# Altium project AudioMoth-v1.2.0.PrjPcb (part 3 of 3)
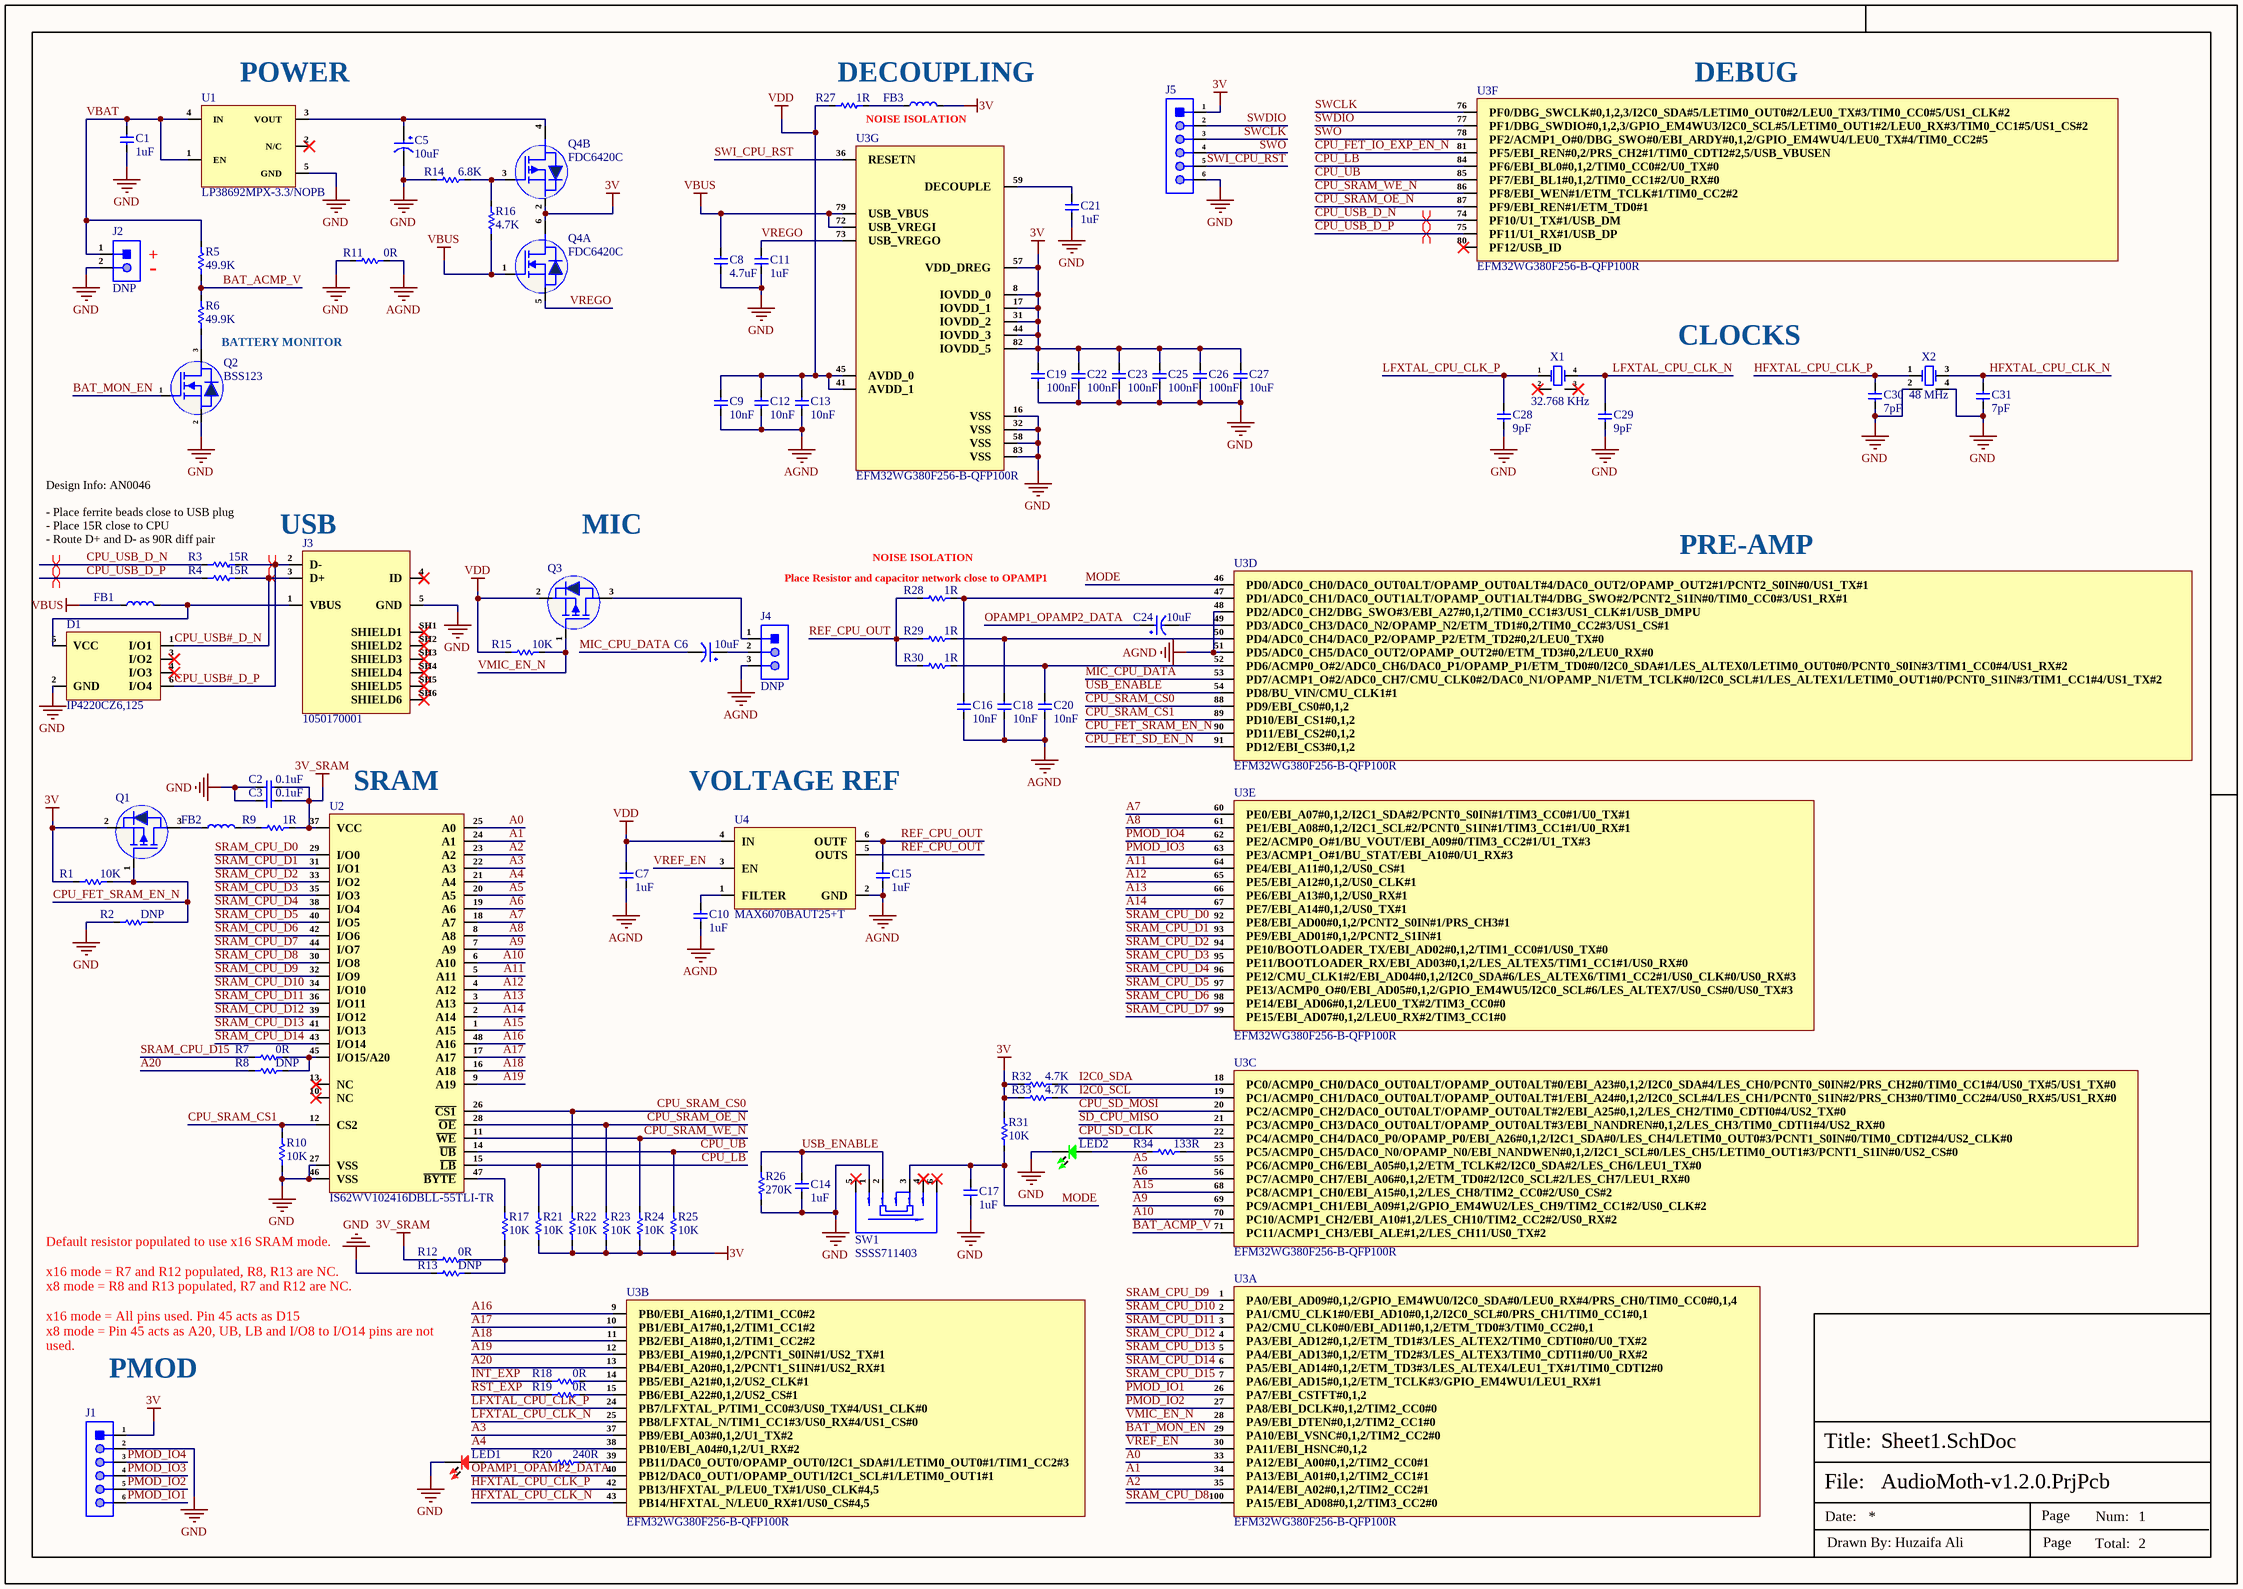
[diagram p3: Sheet1.SchDoc]

## Sheet Sheet1.SchDoc (continued)

### Library data of the parts (continued)
U2 = IS62WV102416DBLL-55TLI-TR: IC SRAM 16MBIT PARALLEL 48TSOP I; Manufacturer: ISSI; Memory Format: Volatile,SRAM; Memory Size: 16Mb; Access Time: 55ns; Supplier: Digikey; Supplier Part Number: 706-IS62WV102416DBLL-55TLI-TRCT-ND; Manufacturer Part Number: IS62WV102416DBLL-55TLI-TR; RoHS: Yes; Item Type: IC; Stock: 1390; Pricing: 1=11.11, 10=9.865, 25=9.408, 50=9.0762, 100=8.7557, 250=8.34852, 500=8.05256 (USD); Mounting Technology: Surface Mount; Case/Package: TFSOP; Min Operating Temperature: -40°C; Max Operating Temperature: 85°C; Packaging: Tape and Reel; Series: -; RoHS Compliant: Yes; ComponentLink1URL: http://www.mouser.com/ds/2/198/62-65WV102416DALL-DBLL-319010.pdf?src-supplier=Mouser; ComponentLink1Description: http://www.mouser.com/ds/2/198/62-65WV102416DALL-DBLL-319010.pdf?src-supplier=Mouser; ComponentLink2URL: http://www.issi.com/WW/pdf/62-65WV102416DALL-DBLL.pdf?src-supplier=Avnet; ComponentLink2Description: http://www.issi.com/WW/pdf/62-65WV102416DALL-DBLL.pdf?src-supplier=Avnet; ComponentLink3URL: http://www.issi.com/WW/pdf/62-65WV102416DALL-DBLL.pdf?src-supplier=Digikey; ComponentLink3Description: http://www.issi.com/WW/pdf/62-65WV102416DALL-DBLL.pdf?src-supplier=Digikey
U3 = EFM32WG380F256-B-QFP100R: IC MCU 32BIT 256KB FLASH 100LQFP; Manufacturer: Silicon Labs; Supplier: Mouser; Supplier Part Number: 634-WG380256BQFP100R; Manufacturer Part Number: EFM32WG380F256-B-QFP100R; Item Type: IC; Stock: 2000; Pricing: 1=13.12, 10=12.06, 50=11.56, 100=10.18, 1000=8.31, 10000=8.31 (USD)
U4 = MAX6070BAUT25+T: IC VREF SERIES 0.08% SOT23-6; Manufacturer: Analog Devices; Output Type: 6317OutputType; Reference Type: 6142ReferenceType; Max Supply Voltage: 5.5V; Max Output current: 10mA; Min Input Voltage: 2.7V; Min Output Voltage: 2.5V; Number of Channels: 1NUMBER; Operating Supply Current: 300uA; Quiescent Current: 235uA; Supplier: Mouser; LCSC Part Number: C143531; Manufacturer Part Number: MAX6070BAUT25+T; RoHS: No; Item Type: IC; Stock: 5392; Pricing: 1=3.56, 10=2.63, 50=2.63, 100=2.19, 1000=1.72, 10000=1.53 (USD); Mounting Technology: 8Mount; Case/Package: 942Case; Pins: 6NUMBER; Min Operating Temperature: -40°C; Max Operating Temperature: 125°C; Tolerance: 0.08%; Output Current: 10mA; Output Voltage: 2.5V; Radiation Hardening: 5898YesNo; ComponentLink1URL: https://datasheet.octopart.com/MAX6070BAUT25%2BT-Analog-Devices-datasheet-134530559.pdf?src-supplier=LKR; ComponentLink1Description: https://datasheet.octopart.com/MAX6070BAUT25%2BT-Analog-Devices-datasheet-134530559.pdf?src-supplier=LKR
X1 = Q13MC14620001: 32.768kHz 7pF ±20ppm MC-146 Crystals ROHS; Manufacturer: Seiko Epson; Manufacturer Part Number: Q13MC14620001; Package: MC-146; LCSC Part Number: C3013800; Item Type: Crystals; ComponentLink1Description: LCSC; ComponentLink1URL: https://www.lcsc.com/product-detail/Crystals_Seiko-span-style-background-color-ff0-Epson-span-Q13MC14620001_C3013800.html
X2 = XRCGB48M000F4M00R0: CRYSTAL 48.0000MHZ 6PF SMD; Manufacturer: Murata; Item Type: Crystals; Supplier: Mouser; LCSC Part Number: C1986590; Manufacturer Part Number: XRCGB48M000F4M00R0; RoHS: Yes; Stock: 4711; Pricing: 1=0.3, 10=0.231, 50=0.231, 100=0.211, 1000=0.179, 10000=0.128 (USD); ComponentLink1URL: https://datasheet.ciiva.com/3852/part29-3852564.pdf?src-supplier=Arrow+Electronics; ComponentLink1Description: https://datasheet.ciiva.com/3852/part29-3852564.pdf?src-supplier=Arrow+Electronics; ComponentLink2URL: https://datasheet.ciiva.com/852/p79e-852304.pdf?src-supplier=Digikey; ComponentLink2Description: https://datasheet.ciiva.com/852/p79e-852304.pdf?src-supplier=Digikey; ComponentLink3URL: https://datasheet.ciiva.com/852/p79e-852305.pdf?src-supplier=Digikey; ComponentLink3Description: https://datasheet.ciiva.com/852/p79e-852305.pdf?src-supplier=Digikey; ComponentLink4URL: https://datasheet.ciiva.com/852/p79e-852306.pdf?src-supplier=Digikey; ComponentLink4Description: https://datasheet.ciiva.com/852/p79e-852306.pdf?src-supplier=Digikey; ComponentLink5URL: https://datasheet.ciiva.com/1369/l0445e-1369913.pdf?src-supplier=Farnell; ComponentLink5Description: https://datasheet.ciiva.com/1369/l0445e-1369913.pdf?src-supplier=Farnell; ComponentLink6URL: https://datasheet.ciiva.com/1361/p79e-1361575.pdf?src-supplier=Element14; ComponentLink6Description: https://datasheet.ciiva.com/1361/p79e-1361575.pdf?src-supplier=Element14

## Sheet Sheet2.SchDoc
size 420 x 297 mm; SheetNumber: 2; SheetTotal: 2
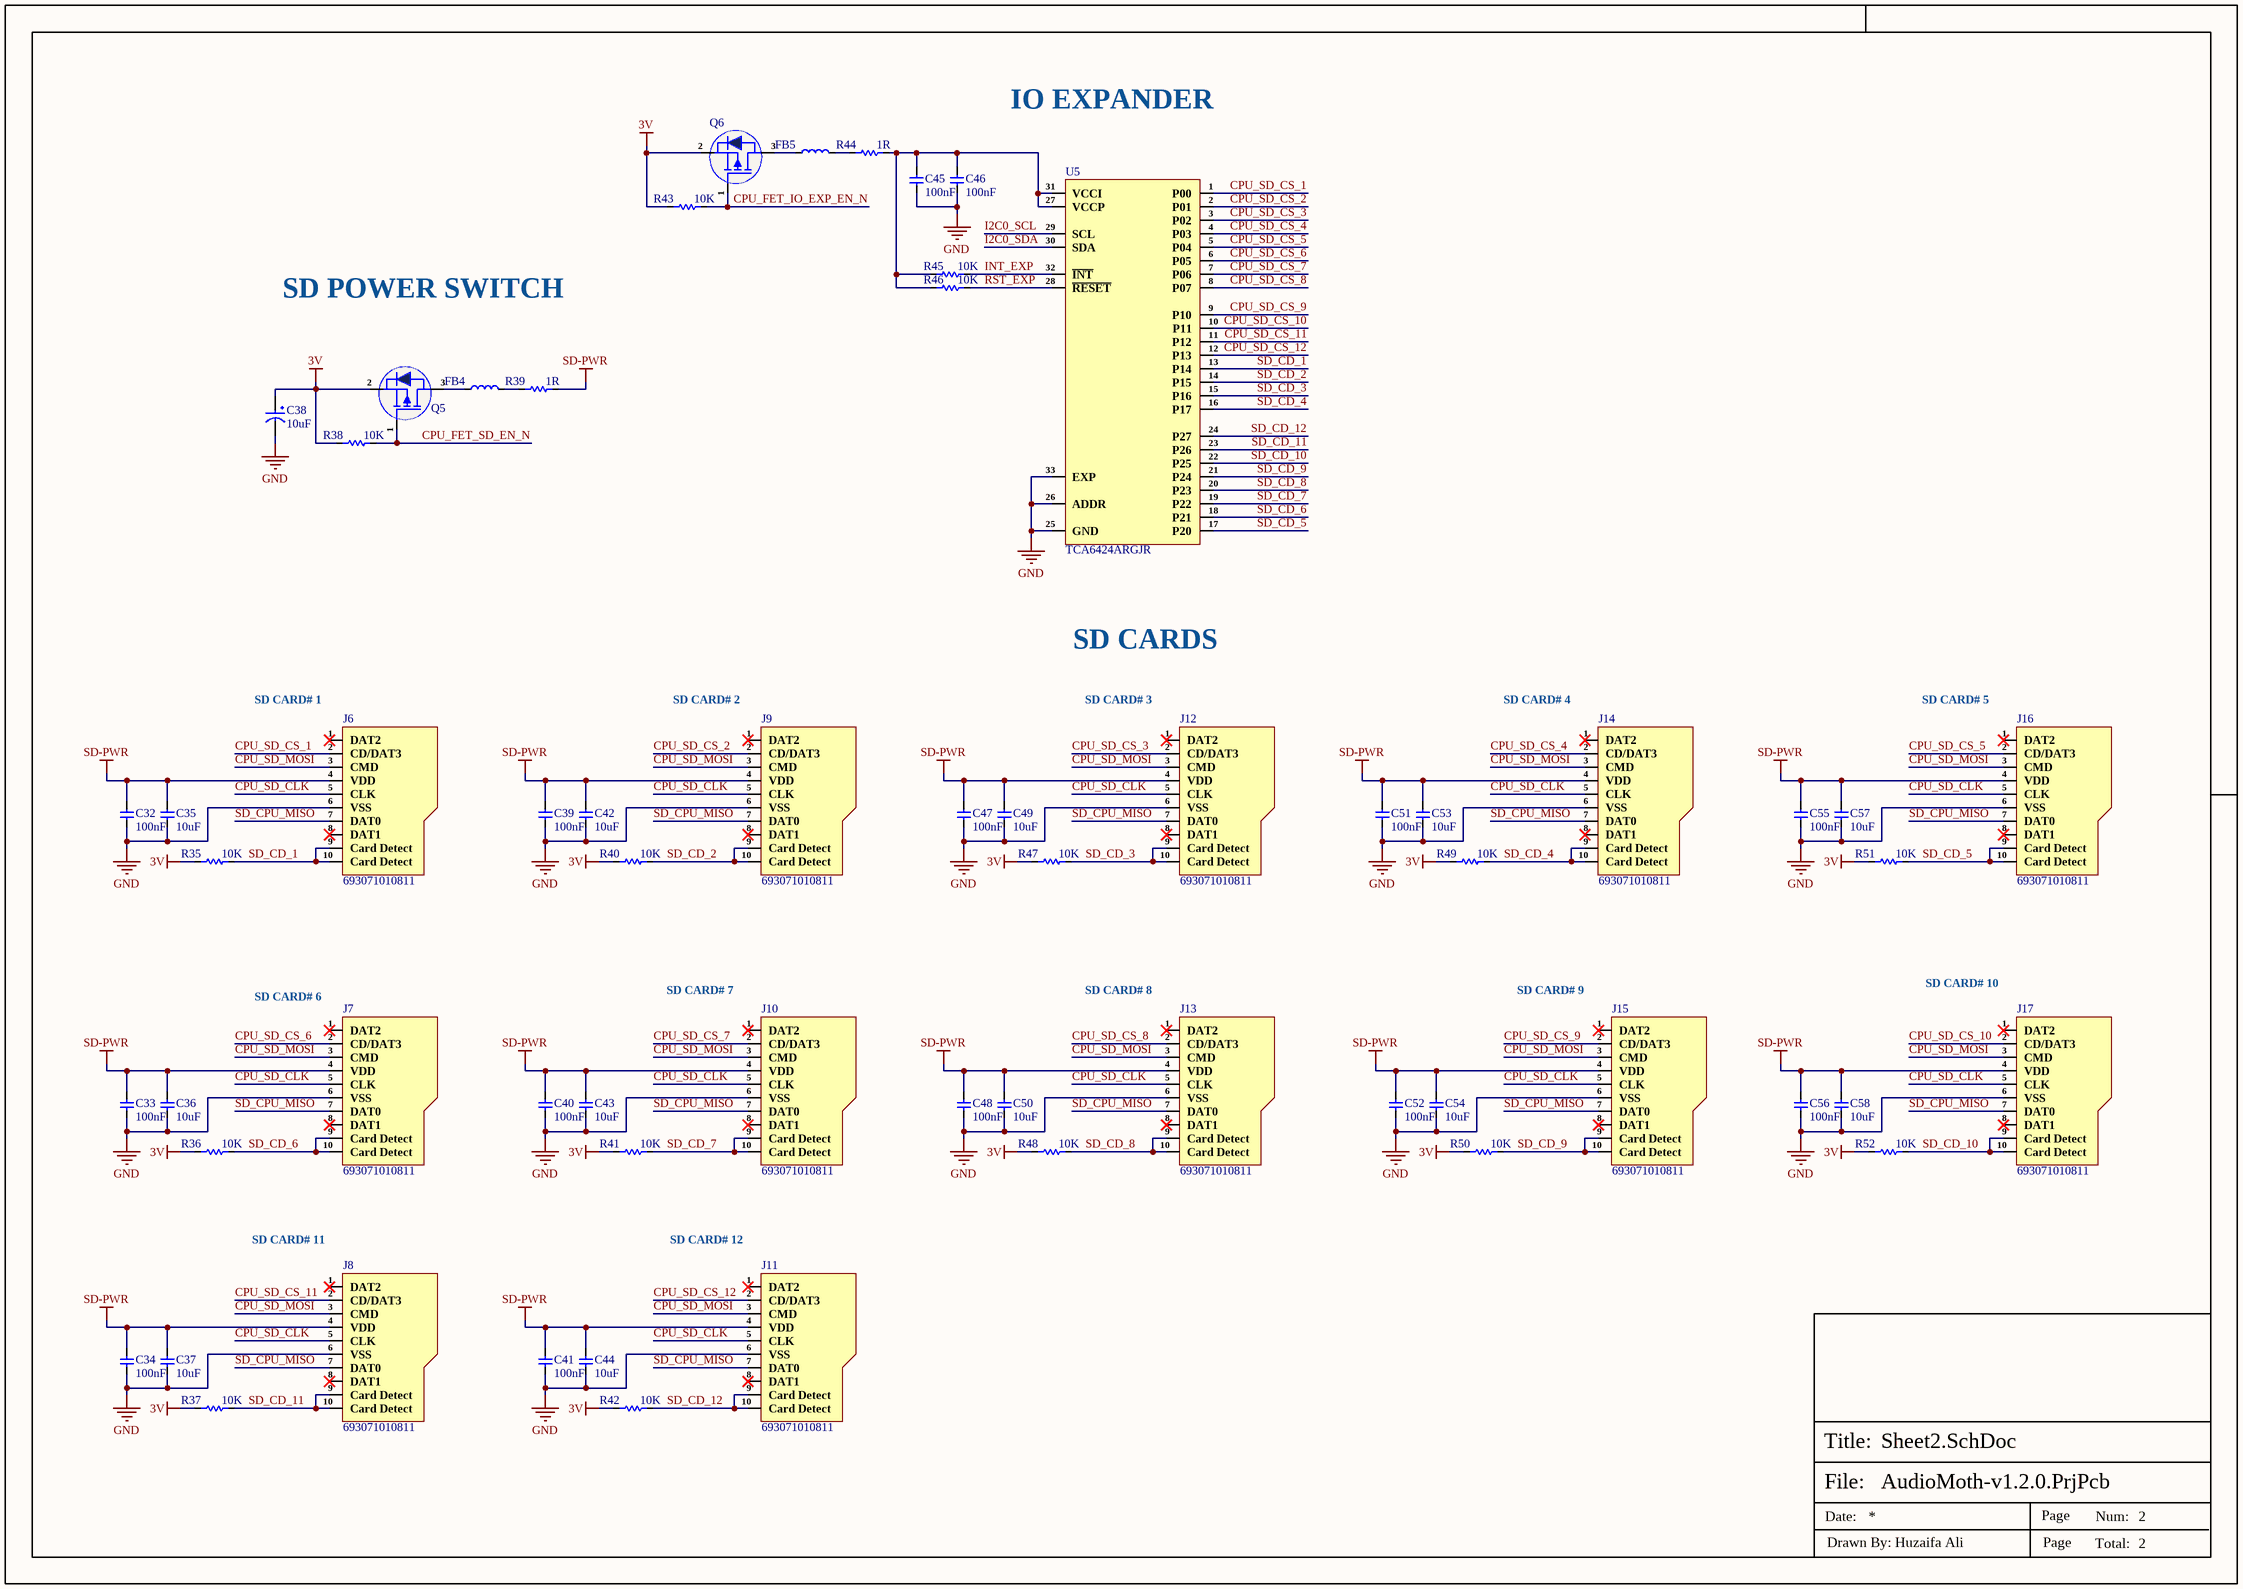
[diagram p1: Sheet2.SchDoc]

### Parts
C32  100nF  [cap-0402]
C33  100nF  [cap-0402]
C34  100nF  [cap-0402]
C35  10uF  [Cap-0603]
C36  10uF  [Cap-0603]
C37  10uF  [Cap-0603]
C38  10uF  [Case-A]
C39  100nF  [cap-0402]
C40  100nF  [cap-0402]
C41  100nF  [cap-0402]
C42  10uF  [Cap-0603]
C43  10uF  [Cap-0603]
C44  10uF  [Cap-0603]
C45  100nF  [cap-0402]
C46  100nF  [cap-0402]
C47  100nF  [cap-0402]
C48  100nF  [cap-0402]
C49  10uF  [Cap-0603]
C50  10uF  [Cap-0603]
C51  100nF  [cap-0402]
C52  100nF  [cap-0402]
C53  10uF  [Cap-0603]
C54  10uF  [Cap-0603]
C55  100nF  [cap-0402]
C56  100nF  [cap-0402]
C57  10uF  [Cap-0603]
C58  10uF  [Cap-0603]
FB4  BLM18HG601SN1D  [IND-0603 (1608 Metric)]  (value not drawn)
FB5  BLM18HG601SN1D  [IND-0603 (1608 Metric)]  (value not drawn)
J6  693071010811  [693071010811]
J7  693071010811  [693071010811]
J8  693071010811  [693071010811]
J9  693071010811  [693071010811]
J10  693071010811  [693071010811]
J11  693071010811  [693071010811]
J12  693071010811  [693071010811]
J13  693071010811  [693071010811]
J14  693071010811  [693071010811]
J15  693071010811  [693071010811]
J16  693071010811  [693071010811]
J17  693071010811  [693071010811]
Q5  DMG3415U  [SOT-23]  (value not drawn)
Q6  LBSS84WT1G  [SC-70]  (value not drawn)
R35  10K  [Res-0402]
R36  10K  [Res-0402]
R37  10K  [Res-0402]
R38  10K  [Res-0402]
R39  1R  [Res-0402]
R40  10K  [Res-0402]
R41  10K  [Res-0402]
R42  10K  [Res-0402]
R43  10K  [Res-0402]
R44  1R  [Res-0402]
R45  10K  [Res-0402]
R46  10K  [Res-0402]
R47  10K  [Res-0402]
R48  10K  [Res-0402]
R49  10K  [Res-0402]
R50  10K  [Res-0402]
R51  10K  [Res-0402]
R52  10K  [Res-0402]
U5  TCA6424ARGJR  [32-UQFN (5x5)]

### Nets
3V: C38.1 Q5.2(S) Q6.2(S) R35.1 R36.1 R37.1 R38.1 R40.1 R41.1 R42.1 R43.1 R47.1 R48.1 R49.1 R50.1 R51.1 R52.1
GND: C32.1 C33.1 C34.1 C35.1 C36.1 C37.1 C38.2 C39.1 C40.1 C41.1 C42.1 C43.1 C44.1 C45.1 C46.1 C47.1 C48.1 C49.1 C50.1 C51.1 C52.1 C53.1 C54.1 C55.1 C56.1 C57.1 C58.1 J6.6(VSS) J7.6(VSS) J8.6(VSS) J9.6(VSS) J10.6(VSS) J11.6(VSS) J12.6(VSS) J13.6(VSS) J14.6(VSS) J15.6(VSS) J16.6(VSS) J17.6(VSS) U5.25(GND) U5.26(ADDR) U5.33(EXP)
SD-PWR: C32.2 C33.2 C34.2 C35.2 C36.2 C37.2 C39.2 C40.2 C41.2 C42.2 C43.2 C44.2 C47.2 C48.2 C49.2 C50.2 C51.2 C52.2 C53.2 C54.2 C55.2 C56.2 C57.2 C58.2 J6.4(VDD) J7.4(VDD) J8.4(VDD) J9.4(VDD) J10.4(VDD) J11.4(VDD) J12.4(VDD) J13.4(VDD) J14.4(VDD) J15.4(VDD) J16.4(VDD) J17.4(VDD) R39.1
CPU_FET_IO_EXP_EN_N: Q6.1(G) R43.2
CPU_FET_SD_EN_N: Q5.1(G) R38.2
CPU_SD_CLK: J6.5(CLK) J7.5(CLK) J8.5(CLK) J9.5(CLK) J10.5(CLK) J11.5(CLK) J12.5(CLK) J13.5(CLK) J14.5(CLK) J15.5(CLK) J16.5(CLK) J17.5(CLK)
CPU_SD_CS_1: J6.2(CD/DAT3) U5.1(P00)
CPU_SD_CS_2: J9.2(CD/DAT3) U5.2(P01)
CPU_SD_CS_3: J12.2(CD/DAT3) U5.3(P02)
CPU_SD_CS_4: J14.2(CD/DAT3) U5.4(P03)
CPU_SD_CS_5: J16.2(CD/DAT3) U5.5(P04)
CPU_SD_CS_6: J7.2(CD/DAT3) U5.6(P05)
CPU_SD_CS_7: J10.2(CD/DAT3) U5.7(P06)
CPU_SD_CS_8: J13.2(CD/DAT3) U5.8(P07)
CPU_SD_CS_9: J15.2(CD/DAT3) U5.9(P10)
CPU_SD_CS_10: J17.2(CD/DAT3) U5.10(P11)
CPU_SD_CS_11: J8.2(CD/DAT3) U5.11(P12)
CPU_SD_CS_12: J11.2(CD/DAT3) U5.12(P13)
CPU_SD_MOSI: J6.3(CMD) J7.3(CMD) J8.3(CMD) J9.3(CMD) J10.3(CMD) J11.3(CMD) J12.3(CMD) J13.3(CMD) J14.3(CMD) J15.3(CMD) J16.3(CMD) J17.3(CMD)
I2C0_SCL: U5.29(SCL)
I2C0_SDA: U5.30(SDA)
INT_EXP: R45.1 U5.32(~{INT})
RST_EXP: R46.1 U5.28(~{RESET})
SD_CD_1: J6.9(Card_Detect) J6.10(Card_Detect) R35.2 U5.13(P14)
SD_CD_2: J9.9(Card_Detect) J9.10(Card_Detect) R40.2 U5.14(P15)
SD_CD_3: J12.9(Card_Detect) J12.10(Card_Detect) R47.2 U5.15(P16)
SD_CD_4: J14.9(Card_Detect) J14.10(Card_Detect) R49.2 U5.16(P17)
SD_CD_5: J16.9(Card_Detect) J16.10(Card_Detect) R51.2 U5.17(P20)
SD_CD_6: J7.9(Card_Detect) J7.10(Card_Detect) R36.2 U5.18(P21)
SD_CD_7: J10.9(Card_Detect) J10.10(Card_Detect) R41.2 U5.19(P22)
SD_CD_8: J13.9(Card_Detect) J13.10(Card_Detect) R48.2 U5.20(P23)
SD_CD_9: J15.9(Card_Detect) J15.10(Card_Detect) R50.2 U5.21(P24)
SD_CD_10: J17.9(Card_Detect) J17.10(Card_Detect) R52.2 U5.22(P25)
SD_CD_11: J8.9(Card_Detect) J8.10(Card_Detect) R37.2 U5.23(P26)
SD_CD_12: J11.9(Card_Detect) J11.10(Card_Detect) R42.2 U5.24(P27)
SD_CPU_MISO: J6.7(DAT0) J7.7(DAT0) J8.7(DAT0) J9.7(DAT0) J10.7(DAT0) J11.7(DAT0) J12.7(DAT0) J13.7(DAT0) J14.7(DAT0) J15.7(DAT0) J16.7(DAT0) J17.7(DAT0)
NetC45_2: C45.2 C46.2 R44.1 R45.2 R46.2 U5.27(VCCP) U5.31(VCCI)
NetFB4_1: FB4.1 Q5.3(D)
NetFB4_2: FB4.2 R39.2
NetFB5_1: FB5.1 Q6.3(D)
NetFB5_2: FB5.2 R44.2

Not connected (* = marked no-connect by the designer): J6 1(DAT2)* 8(DAT1)*; J7 1(DAT2)* 8(DAT1)*; J8 1(DAT2)* 8(DAT1)*; J9 1(DAT2)* 8(DAT1)*; J10 1(DAT2)* 8(DAT1)*; J11 1(DAT2)* 8(DAT1)*; J12 1(DAT2)* 8(DAT1)*; J13 1(DAT2)* 8(DAT1)*; J14 1(DAT2)* 8(DAT1)*; J15 1(DAT2)* 8(DAT1)*; J16 1(DAT2)* 8(DAT1)*; J17 1(DAT2)* 8(DAT1)*

### Notes on the sheet
- IO EXPANDER
- SD POWER SWITCH
- SD CARDS
- (near J6) SD CARD# 1
- (near J9) SD CARD# 2
- (near J12) SD CARD# 3
- (near J14) SD CARD# 4
- (near J16) SD CARD# 5
- (near J7) SD CARD# 6
- (near J10) SD CARD# 7
- (near J13) SD CARD# 8
- (near J15) SD CARD# 9
- (near J17) SD CARD# 10
- (near J8) SD CARD# 11
- (near J11) SD CARD# 12
- File:
- Title:
- Date:
- Page
- Num:
- Total:
- Drawn By: Huzaifa Ali

### Library data of the parts
C32-C34 C39-C41 C45-C48 C51 C52 C55 C56 = C1005X7R1H104KT000F: CAP CER 0.1UF 50V X7R 0402; Manufacturer: TDK; Tolerance: 10%; Voltage: 25V; Item Type: Capacitor; Supplier 1: Avnet; Manufacturer Part Number: C1005X7R1H104KT000F; RoHS: No; Category: Ceramic Capacitors; Dielectric: X7R; Supplier Part Number 1: C1005X7R1H104KT000F; LCSC Part Number: C361198; ComponentLink1Description: LCSC; ComponentLink1URL: https://www.lcsc.com/product-detail/Multilayer-Ceramic-Capacitors-MLCC-SMD-SMT_TDK-C1005X7R1H104KT000F_C361198.html
C35-C37 C42-C44 C49 C50 C53 C54 C57 C58 = CL10A106MA8NRNC: CAP CER 10UF 25V X5R 0603; Manufacturer: Samsung; Tolerance: 20%; Supplier 1: Avnet; Manufacturer Part Number: CL10A106MA8NRNC; RoHS: Yes; Category: Ceramic Capacitors; Pricing 1: 4000=0.03753, 8000=0.03700, 16000=0.03595, 24000=0.03515, 32000=0.03383, 40000=0.03304, 400000=0.03225 (USD); Mount: Surface Mount; Case/Package: 0603; Case Code (Metric): 1608; Case Code (Imperial): 0603; Contact Plating: Tin; Min Operating Temperature: -55°C; Max Operating Temperature: 85°C; Package Quantity: 1; Packaging: Tape and Reel; Capacitance: 10uF; Voltage Rating: 25V; Dielectric: X5R; Termination: Wraparound; Series: CL; Construction: Flat; Length: 0.063inch; Width: 0.031inch; Thickness: 0.035inch; Lead Free: Lead Free; RoHS Compliant: Yes; ComponentLink1URL: https://datasheet.ciiva.com/25766/cl10a106ma8nrnc-25766562.pdf?src-supplier=Digi-Key; ComponentLink1Description: https://datasheet.ciiva.com/25766/cl10a106ma8nrnc-25766562.pdf?src-supplier=Digi-Key; Supplier Part Number 1: CL10A106MA8NRNC; LCSC Part Number: C96446
C38 = CA45-A-16V-10uF-K: 10uF 16V 2Ω@100kHz ±10% CASE-A-3216-16(mm) Tantalum Capacitors ROHS; Manufacturer: TORCH; Manufacturer Part Number: CA45-A-16V-10μF-K; Package: CASE-A-3216-16(mm); LCSC Part Number: C185774; Item Type: Capacitors; ComponentLink1Description: LCSC; ComponentLink1URL: https://www.lcsc.com/product-detail/Tantalum-Capacitors_TORCH-CA45-A-16V-10-F-K_C185774.html
FB4 FB5 = BLM18HG601SN1D: FERRITE BEAD 600 OHM 0603 1LN; Manufacturer: Murata; Manufacturer Series: BLM18H; Item Type: Ferrite Beads; Material: Steel,Ferrite; Impedance: 600R; Tolerance: 25%; DC Resistance (DCR): 1R; Max DC Current: 200mA; Number of Lines: 1; Test Frequency: 100MHz; Supplier: Future Electronics; LCSC Part Number: C85830; Manufacturer Part Number: BLM18HG601SN1D; RoHS: Yes; Stock: 80000; Pricing: 4000=0.0428, 12000=0.0412, 20000=0.0405, 80000=0.0387, 120000=0.0375 (USD); Case/Package: 0603; Pins: 2; Core Material: Ferrite; Case Code (Metric): 1608; Case Code (Imperial): 0603; Weight: 7.1E-05oz; Terminal Finish: Tin; Min Operating Temperature: -55°C; Max Operating Temperature: 125°C; Package Quantity: 1; Packaging: Tape and Reel; Current Rating: 200mA; ESR (Equivalent Series Resistance): 600R; Max Current Rating: 200mA; Termination: SMD/SMT; DC Current: 200mA; Number of Circuits: 1; Series: BLM18H; Channels: 1; DC Resistance-Max: 1R; Length: 1.6mm; Width: 0.8mm; Height: 0.8mm; Depth: 0.8mm; Radiation Hardening: No; Reach SVHC Compliant: No; Lead Free: Lead Free; RoHS Compliant: Yes; ComponentLink1URL: https://datasheet.ciiva.com/19458/1844993-19458415.pdf?src-supplier=Jameco; ComponentLink1Description: https://datasheet.ciiva.com/19458/1844993-19458415.pdf?src-supplier=Jameco; ComponentLink2URL: https://datasheet.ciiva.com/11800/0900766b811b5866-11800880.pdf?src-supplier=Rs; ComponentLink2Description: https://datasheet.ciiva.com/11800/0900766b811b5866-11800880.pdf?src-supplier=Rs; ComponentLink3URL: https://datasheet.ciiva.com/41449/001171708-da-01-en-chip-drossel0603-600r-200ma-1-6x0-8mm-41449386.pdf?src-supplier=Conrad; ComponentLink3Description: https://datasheet.ciiva.com/41449/001171708-da-01-en-chip-drossel0603-600r-200ma-1-6x0-8mm-41449386.pdf?src-supplier=Conrad; ComponentLink4URL: https://datasheet.ciiva.com/41449/001172283-da-01-en-drossel-0603-600r-1-6x0-8mm-4000st-41449622.pdf?src-supplier=Conrad; ComponentLink4Description: https://datasheet.ciiva.com/41449/001172283-da-01-en-drossel-0603-600r-1-6x0-8mm-4000st-41449622.pdf?src-supplier=Conrad; ComponentLink5URL: https://datasheet.ciiva.com/6212/l0110s0101blm18h-6212335.pdf?src-supplier=Digikey; ComponentLink5Description: https://datasheet.ciiva.com/6212/l0110s0101blm18h-6212335.pdf?src-supplier=Digikey; ComponentLink6URL: https://datasheet.ciiva.com/3081/l0110s0101blm18h-3081629.pdf?src-supplier=Avnet; ComponentLink6Description: https://datasheet.ciiva.com/3081/l0110s0101blm18h-3081629.pdf?src-supplier=Avnet; ComponentLink7URL: https://datasheet.ciiva.com/3082/l0110s0101blm18h-3082720.pdf?src-supplier=Avnet; ComponentLink7Description: https://datasheet.ciiva.com/3082/l0110s0101blm18h-3082720.pdf?src-supplier=Avnet
J6-J17 = 693071010811: CONN MICRO SD CARD PUSH-PUSH R/A; Manufacturer: Wurth Electronics; Item Type: Memory Connectors; Number of Contacts: 8; Current Rating: 500mA; Insulation Resistance: 1GR; Operating Supply Voltage: 100V; Memory Format: 4498,11064MemoryType; Supplier: Mouser; LCSC Part Number: C2680620; Manufacturer Part Number: 693071010811; RoHS: Yes; Stock: 22534; Pricing: 1=3.11, 10=3.04, 50=2.68, 100=2.56, 1000=2.19, 10000=2 (USD); Mounting Technology: Surface Mount; Contact Material: Copper Alloy,Copper,Gold; Contact Plating: Gold; Min Operating Temperature: -25°C; Max Operating Temperature: 85°C; Package Quantity: 1; Packaging: Cut Tape; Series: -; Voltage Rating: 100V; Length: 14mm; Width: 15.2mm; Height: 1.98mm; RoHS Compliant: Yes; Reach SVHC Compliant: Unknown; Lead Free: Lead Free; ComponentLink1URL: https://datasheet.ciiva.com/6935/693071010811-6935152.pdf?src-supplier=Digikey; ComponentLink1Description: https://datasheet.ciiva.com/6935/693071010811-6935152.pdf?src-supplier=Digikey; ComponentLink2URL: https://datasheet.ciiva.com/25605/0900766b81113f2e-25605369.pdf?src-supplier=Rs; ComponentLink2Description: https://datasheet.ciiva.com/25605/0900766b81113f2e-25605369.pdf?src-supplier=Rs; ComponentLink3URL: https://datasheet.ciiva.com/1104/1759178-1104796.pdf?src-supplier=Element14; ComponentLink3Description: https://datasheet.ciiva.com/1104/1759178-1104796.pdf?src-supplier=Element14; ComponentLink4URL: https://datasheet.ciiva.com/6935/693071010811-6935146.pdf?src-supplier=Digikey; ComponentLink4Description: https://datasheet.ciiva.com/6935/693071010811-6935146.pdf?src-supplier=Digikey
Q5 = DMG3415U: P-Channel MOSFETs ROHS; Manufacturer: TECH PUBLIC; Item Type: MOSFET; Manufacturer Part Number: DMG3415U; Package: SOT-23; LCSC Part Number: C7202986; ComponentLink1Description: LCSC; ComponentLink1URL: https://www.lcsc.com/product-detail/MOSFETs_TECH-PUBLIC-DMG3415U_C7202986.html
Q6 = LBSS84WT1G: 50V 130mA 5Ω@10V,100mA 225mW 2V@250uA 1 Piece P-Channel SC-70 MOSFETs ROHS; Manufacturer: LRC; Manufacturer Part Number: LBSS84WT1G; Package: SC-70; LCSC Part Number: C383208; Item Type: MOSFETs; ComponentLink1Description: LCSC; ComponentLink1URL: https://www.lcsc.com/product-detail/MOSFETs_LRC-LBSS84WT1G_C383208.html
R35-R38 R40-R43 R45-R52 = RC0402FR-0710KL: RES 10K OHM 1% 1/16W 0402; Manufacturer: Yageo; Resistance: 10kR; Voltage Rating (DC): 50V; Temperature Coefficient: 100ppm/°C; Power Rating: 62.5mW; Max Power Dissipation: 63mW; Item Type: Resistor; Supplier 1: Mouser; Manufacturer Part Number: RC0402FR-0710KL; RoHS: Yes; Category: Chip SMD Resistors; Stock 1: 18648329; Pricing 1: 1=0.10000, 10=0.01400, 50=0.01400, 100=0.00500, 1000=0.00300, 10000=0.00200 (USD); Case/Package: 0402; Number of Pins: 2; Case Code (Imperial): 0402; Case Code (Metric): 1005; Min Operating Temperature: -55°C; Max Operating Temperature: 155°C; Resistor Type: Thick Film; Tolerance: 1%; Packaging: Tape and Reel; Voltage Rating: 50V; Termination: SMD/SMT; Working Voltage: 50V; Number of Terminations: 2; Features: Moisture Resistant; Series: RC; Resistance Tolerance: 1%; Construction: Rectangular; Length: 1mm; Width: 0.5mm; Height: 0.32mm; Depth: 0.5mm; Lead Pitch: 0.2mm; REACH SVHC: No SVHC; Lead Free: Lead Free; RoHS Compliant: Yes; Military Standard: Not; ComponentLink1URL: https://datasheet.ciiva.com/7660/38568-7660787.pdf?src-supplier=Element14; ComponentLink1Description: https://datasheet.ciiva.com/7660/38568-7660787.pdf?src-supplier=Element14; ComponentLink2URL: https://datasheet.ciiva.com/7849/1686128-7849814.pdf?src-supplier=Element14; ComponentLink2Description: https://datasheet.ciiva.com/7849/1686128-7849814.pdf?src-supplier=Element14; ComponentLink3URL: https://datasheet.ciiva.com/7983/1018594-7983486.pdf?src-supplier=Element14; ComponentLink3Description: https://datasheet.ciiva.com/7983/1018594-7983486.pdf?src-supplier=Element14; ComponentLink4URL: https://datasheet.ciiva.com/22747/1018594-22747512.pdf?src-supplier=Element14; ComponentLink4Description: https://datasheet.ciiva.com/22747/1018594-22747512.pdf?src-supplier=Element14; ComponentLink5URL: https://datasheet.ciiva.com/12667/pyu-rc0402-51-rohs-l-6-r-12667067.pdf?src-supplier=Mouser; ComponentLink5Description: https://datasheet.ciiva.com/12667/pyu-rc0402-51-rohs-l-6-r-12667067.pdf?src-supplier=Mouser; ComponentLink6URL: https://datasheet.ciiva.com/7849/1784430-7849813.pdf?src-supplier=Element14; ComponentLink6Description: https://datasheet.ciiva.com/7849/1784430-7849813.pdf?src-supplier=Element14; ComponentLink7URL: https://datasheet.ciiva.com/7849/1784430-7849815.pdf?src-supplier=Element14; ComponentLink7Description: https://datasheet.ciiva.com/7849/1784430-7849815.pdf?src-supplier=Element14; Supplier Part Number 1: 603-RC0402FR-0710KL; LCSC Part Number: C60490
R39 R44 = RC0402FR-071RL: RES 1 OHM 1% 1/16W 0402; Manufacturer: Yageo; Power Rating: 62.5mW; Voltage Rating: 50V; Temperature Coefficient: 200ppm/°C; Max Power Dissipation: 63mW; Item Type: Resistor; Supplier 1: Mouser; Manufacturer Part Number: RC0402FR-071RL; RoHS: Yes; Category: Chip SMD Resistors; Stock 1: 239284; Pricing 1: 1=0.10000, 10=0.02200, 50=0.02200, 100=0.00900, 1000=0.00400, 10000=0.00200 (USD); Case/Package: 0402; Case Code (Imperial): 0402; Case Code (Metric): 1005; Min Operating Temperature: -55°C; Max Operating Temperature: 155°C; Resistance: 1R; Tolerance: 1%; Packaging: Tape and Reel; Termination: SMD/SMT; Resistor Type: Thick Film; Voltage Rating (DC): 50V; Working Voltage: 50V; Number of Terminations: 2; Features: Moisture Resistant; Series: RC; Construction: Rectangular; Technology: THICK FILM; Resistance Tolerance: 1%; Length: 1mm; Height: 0.32mm; Depth: 0.5mm; REACH SVHC: No SVHC; Military Standard: Not; Lead Free: Lead Free; RoHS Compliant: Yes; ComponentLink1URL: https://datasheet.ciiva.com/11808/0900766b80c66297-11808794.pdf?src-supplier=RSComponents; ComponentLink1Description: https://datasheet.ciiva.com/11808/0900766b80c66297-11808794.pdf?src-supplier=RSComponents; ComponentLink2URL: https://datasheet.ciiva.com/7849/1018594-7849895.pdf?src-supplier=Element14; ComponentLink2Description: https://datasheet.ciiva.com/7849/1018594-7849895.pdf?src-supplier=Element14; ComponentLink3URL: https://datasheet.ciiva.com/7849/1018594-7849894.pdf?src-supplier=Element14; ComponentLink3Description: https://datasheet.ciiva.com/7849/1018594-7849894.pdf?src-supplier=Element14; ComponentLink4URL: https://datasheet.ciiva.com/46394/1018594-46394952.pdf?src-supplier=Element14; ComponentLink4Description: https://datasheet.ciiva.com/46394/1018594-46394952.pdf?src-supplier=Element14; ComponentLink5URL: https://datasheet.ciiva.com/12667/pyu-rc0402-51-rohs-l-6-r-12667915.pdf?src-supplier=Mouser; ComponentLink5Description: https://datasheet.ciiva.com/12667/pyu-rc0402-51-rohs-l-6-r-12667915.pdf?src-supplier=Mouser; ComponentLink6URL: https://datasheet.ciiva.com/16740/pyu-rc0402-51-rohs-l-6-r-16740903.pdf?src-supplier=Future+Electronics; ComponentLink6Description: https://datasheet.ciiva.com/16740/pyu-rc0402-51-rohs-l-6-r-16740903.pdf?src-supplier=Future+Electronics; Supplier Part Number 1: 603-RC0402FR-071RL; LCSC Part Number: C185446
U5 = TCA6424ARGJR: IC XPNDR 400KHZ I2C SMBUS 32UQFN; Manufacturer: Texas Instruments; Min Supply Voltage: 1.65V; Max Supply Voltage: 5.5V; Output Current: 25mA; Number of Outputs: 24; Output Type: PUSH-PULL; Supplier: Mouser; Supplier Part Number: 595-TCA6424ARGJR; Manufacturer Part Number: TCA6424ARGJR; RoHS: Yes; Category: Interface ICs; Stock: 59506; Pricing: 1=2.13, 10=1.81, 50=1.81, 100=1.54, 1000=1.05, 10000=0.894 (USD); Case/Package: QFN; Pins: 32; Weight: 0.002116oz; Min Operating Temperature: -40°C; Max Operating Temperature: 85°C; Packaging: Tape and Reel; Number of I/Os: 24; Clock Frequency: 400kHz; Frequency: 400kHz; Series: -; Length: 5.15mm; Width: 5.15mm; Height: 0.6mm; Radiation Hardening: No; Reach SVHC Compliant: No; Lead Free: Lead Free; RoHS Compliant: Yes; ComponentLink1URL: https://datasheet.ciiva.com/1600/tca6424a-1600866.pdf?src-supplier=Newark; ComponentLink1Description: https://datasheet.ciiva.com/1600/tca6424a-1600866.pdf?src-supplier=Newark; ComponentLink2URL: https://datasheet.ciiva.com/1496/1535173-1496151.pdf?src-supplier=Element14; ComponentLink2Description: https://datasheet.ciiva.com/1496/1535173-1496151.pdf?src-supplier=Element14; ComponentLink3URL: https://datasheet.ciiva.com/22652/1699435-22652096.pdf?src-supplier=Element14; ComponentLink3Description: https://datasheet.ciiva.com/22652/1699435-22652096.pdf?src-supplier=Element14; ComponentLink4URL: https://datasheet.ciiva.com/1780/tca6424a-1780437.pdf?src-supplier=Digikey; ComponentLink4Description: https://datasheet.ciiva.com/1780/tca6424a-1780437.pdf?src-supplier=Digikey; ComponentLink5URL: https://datasheet.ciiva.com/4826/scps193b-101393-4826180.pdf?src-supplier=Mouser; ComponentLink5Description: https://datasheet.ciiva.com/4826/scps193b-101393-4826180.pdf?src-supplier=Mouser; ComponentLink6URL: https://datasheet.ciiva.com/15134/getdatasheetpartid-254651-15134577.pdf?src-supplier=Verical; ComponentLink6Description: https://datasheet.ciiva.com/15134/getdatasheetpartid-254651-15134577.pdf?src-supplier=Verical; ComponentLink7URL: https://datasheet.ciiva.com/1505/1535173-1505147.pdf?src-supplier=Farnell; ComponentLink7Description: https://datasheet.ciiva.com/1505/1535173-1505147.pdf?src-supplier=Farnell; ComponentLink8URL: https://datasheet.ciiva.com/1780/tca6424a-1780438.pdf?src-supplier=Digikey; ComponentLink8Description: https://datasheet.ciiva.com/1780/tca6424a-1780438.pdf?src-supplier=Digikey; ComponentLink9URL: https://datasheet.ciiva.com/1780/tca6424a-1780439.pdf?src-supplier=Digikey; ComponentLink9Description: https://datasheet.ciiva.com/1780/tca6424a-1780439.pdf?src-supplier=Digikey; ComponentLink10URL: https://datasheet.ciiva.com/14195/tca6424a-14195387.pdf?src-supplier=Avnet; ComponentLink10Description: https://datasheet.ciiva.com/14195/tca6424a-14195387.pdf?src-supplier=Avnet; ComponentLink11URL: https://datasheet.ciiva.com/41460/001187873-da-01-en-ic-i-o-expander-tca6424argjr-uqfn-32-tid-41460550.pdf?src-supplier=Conrad; ComponentLink11Description: https://datasheet.ciiva.com/41460/001187873-da-01-en-ic-i-o-expander-tca6424argjr-uqfn-32-tid-41460550.pdf?src-supplier=Conrad; LCSC Part Number: C80692; Item Type: IC

## Nets that join several sheets
3V: Sheet1 (27 pins), Sheet2 (17 pins)
GND: Sheet1 (43 pins), Sheet2 (42 pins)
CPU_FET_IO_EXP_EN_N: Sheet1 (U3.81), Sheet2 (Q6.1 R43.2)
CPU_FET_SD_EN_N: Sheet1 (U3.91), Sheet2 (Q5.1 R38.2)
CPU_SD_CLK: Sheet1 (U3.22), Sheet2 (12 pins)
CPU_SD_MOSI: Sheet1 (U3.20), Sheet2 (12 pins)
I2C0_SCL: Sheet1 (R33.2 U3.19), Sheet2 (U5.29)
I2C0_SDA: Sheet1 (R32.2 U3.18), Sheet2 (U5.30)
INT_EXP: Sheet1 (R18.1), Sheet2 (R45.1 U5.32)
RST_EXP: Sheet1 (R19.1), Sheet2 (R46.1 U5.28)
SD_CPU_MISO: Sheet1 (U3.21), Sheet2 (12 pins)